# Altium schematic sheet 02_SERVO.SchDoc
size A4; SheetNumber: 2; SheetTotal: 2
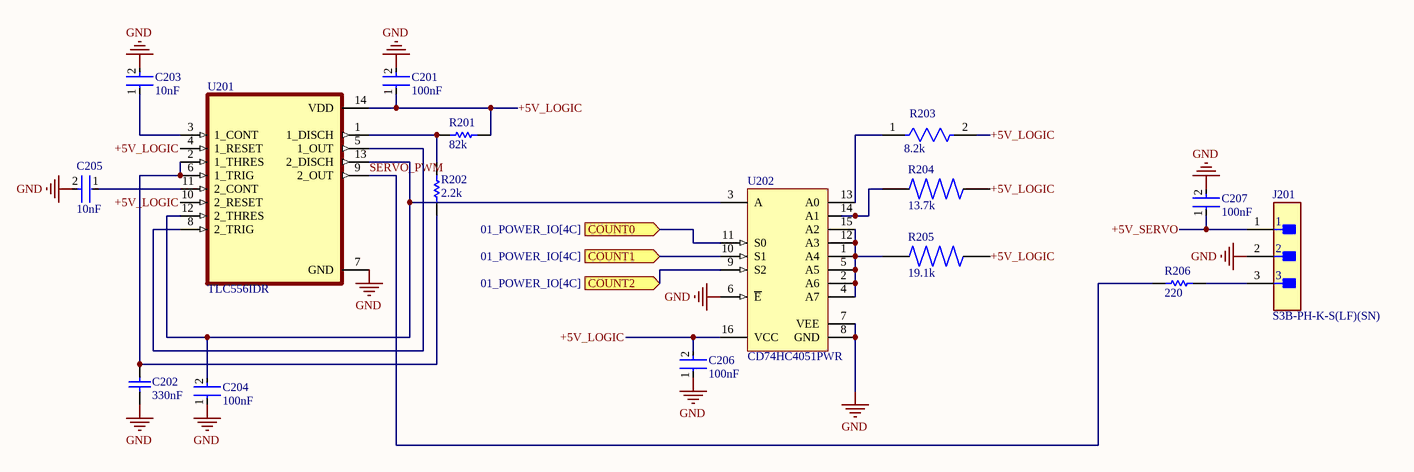
[diagram p0: 02_SERVO.SchDoc]

## Parts
C201  100nF  [FP-C1608-080-0_1-IPC_B]
C202  330nF  [CAPC1608X90X35NL10T15]
C203  10nF  [FP-C1608-080-0_1-MFG]
C204  100nF  [FP-C1608-080-0_1-IPC_B]
C205  10nF  [FP-C1608-080-0_1-MFG]
C206  100nF  [FP-C1608-080-0_1-IPC_B]
C207  100nF  [FP-C1608-080-0_1-IPC_B]
J201  S3B-PH-K-S(LF)(SN)  [FP-S3B-PH-K-S_LF_SN-MFG]
R201  82k  [RESC1608X55X25LL10T15]
R202  2.2k  [RESC1608X55X25LL10T15]
R203  8.2k  [FP-RC0603-0_55-MFG]
R204  13.7k  [RESC1608X55N]
R205  19.1k  [RESC1608X55N]
R206  220  [RESC1608X55X25ML10T15]
U201  TLC556IDR  [SOIC127P600X175-14N]
U202  CD74HC4051PWR  [PW0016A_M]

## Ports
COUNT0 (in, see 01_POWER_IO[4C]), COUNT1 (in, see 01_POWER_IO[4C]), COUNT2 (in, see 01_POWER_IO[4C])

## Nets
GND: C201.2 C202.1 C203.2 C204.1 C205.2 C206.1 C207.2 J201.2 U201.7(GND) U202.6(~{E}) U202.7(VEE) U202.8(GND)
+5V_LOGIC: C201.1 C206.2 R201.2 R203.2 R204.2 R205.2 U201.4(1_RESET) U201.10(2_RESET) U201.14(VDD) U202.16(VCC)
+5V_SERVO: C207.1 J201.1
COUNT0: U202.11(S0) ; port COUNT0
COUNT1: U202.10(S1) ; port COUNT1
COUNT2: U202.9(S2) ; port COUNT2
SERVO_PWM: R206.1 U201.9(2_OUT)
NetC202_2: C202.2 R202.1 U201.2(1_THRES) U201.6(1_TRIG)
NetC203_1: C203.1 U201.3(1_CONT)
NetC204_2: C204.2 U201.12(2_THRES) U201.13(2_DISCH) U202.3(A)
NetC205_1: C205.1 U201.11(2_CONT)
NetJ201_3: J201.3 R206.2
NetR201_1: R201.1 R202.2 U201.1(1_DISCH)
NetR203_1: R203.1 U202.13(A0)
NetR204_1: R204.1 U202.14(A1)
NetR205_1: R205.1 U202.1(A4) U202.2(A6) U202.4(A7) U202.5(A5) U202.12(A3) U202.15(A2)
NetU201_5: U201.5(1_OUT) U201.8(2_TRIG)

## Library data of the parts
C201 C204 C206 C207 = CMP-2000-04982-2: Multilayer Ceramic Capacitors 100nF ±10% 50V X7R SMD 0603; REACH SVHC: No SVHC; Voltage: 50V; Min Operating Temperature: -55°C; Package Quantity: 1; Case Code (Metric): 1608; Series: C; Termination: SMD/SMT; Length: 1.6mm; Voltage Rating: 50V; Case Code (Imperial): 0603; Number of Pins: 2; RoHS Compliant: Yes; Thickness: 0.037inch; Resistor Type: Ceramic; Radiation Hardening: No; Weight: 7.1E-05oz; Mount: Surface Mount; Capacitance: 100nF; Voltage Rating (DC): 50V; Construction: Flat; Tolerance: 10%; Lead Free: Lead Free; Case/Package: 0603; Max Operating Temperature: 125°C; Height: 0.8mm; Depth: 0.8mm; Packaging: Tape and Reel; Width: 0.031inch; Dielectric Material: Ceramic; Dielectric: X7R
C202 = CMP-2006-02854-1: Manufacturer: Murata; Part Number: GRM188R71C334KA01D
C203 C205 = CMP-2000-06026-2: Multilayer Ceramic Capacitors 10nF ±10% 50V X7R SMD 0603; Voltage: 50V; Depth: 0.8mm; REACH SVHC: No SVHC; Packaging: Tape and Reel; Dielectric Material: Ceramic; Dielectric: X7R; Min Operating Temperature: -55°C; Package Quantity: 1; Width: 0.031inch; Case Code (Imperial): 0603; Radiation Hardening: No; Length: 1.6mm; RoHS Compliant: Yes; Tolerance: 10%; Termination: SMD/SMT; Mount: Surface Mount; Construction: Flat; Resistor Type: Ceramic; Max Operating Temperature: 125°C; Series: C; Lead Free: Lead Free; Capacitance: 10nF; Voltage Rating (DC): 50V; Thickness: 0.037inch; Voltage Rating: 50V; Height: 0.8mm; Weight: 7.1E-05oz; Case/Package: 0603; Case Code (Metric): 1608
J201 = CMP-17439-000039-1: CONN HEADER R/A 3POS 2MM; Height: 0.31inch; Weight: 0.0625lb; Length: 0.31inch; Width: 0.31inch
R201 = CMP-2000-06947-1: Chip Resistor, 82 KOhm, +/- 1%, 0.1 W, -55 to 155 degC, 0603 (1608 Metric), RoHS, Tape and Reel; Manufacturer: Yageo; Temperature Coefficient: 100PPM/C; Unit Weight: 0.000071oz; Voltage Rating: 75V; Resistance: 82kOhms; Power Rating: 100mW; Packaging: Reel; Package Description: 2-Pin Surface Mount Device, Body 1.6 x 0.8 mm; Package / Case: 0603(1608metric); Series: RC; Operating Temperature Range: -55Cto+155C; Brand: Yageo; Case Code - in: 0603; Width: 0.8mm; Height: 0.45mm; Product Category: ThickFilmResistors; Length: 1.6mm; Product: ThickFilmResistorsGeneralPurpose; Manufacturer URL: http://www.yageo.com/; Datasheet URL: http://www.yageo.com/documents/recent/PYu-RC_Group_51_RoHS_L_7.pdf; RoHS: True; Datasheet Version: Rev. 7, 05/2017; Tolerance: 1%; Case Code - mm: 1608; Package Reference: 0603; Mounting Technology: SurfaceMount; Type: GeneralPurposeChipResistorSurfaceMount; Termination Style: SMD/SMT
R202 = CMP-2000-06934-1: Thick Film Resistor, 2.2 KOhm, 100 mW, 50 V, +/- 1%, -55 to 155 degC, 2-Pin SMD (0603), RoHS, Tape and Reel; Manufacturer: Yageo; Resistance: 2.2kOhms; Temperature Coefficient: 100PPM/C; Voltage Rating: 50V; Power Rating: 100mW; Tolerance: 1%; Datasheet Version: Rev. 7, 05/2017; Case Code - mm: 1608; Series: RC; Mounting Technology: SurfaceMount; Package Description: 2-Pin Surface Mount Device, Body 1.6 x 0.8 mm; Case Code - in: 0603; Package Reference: 0603; Product: ThickFilmResistorsGeneralPurpose; Manufacturer URL: http://www.yageo.com/; Termination Style: SMD/SMT; Operating Temperature Range: -55Cto+155C; Datasheet URL: http://www.yageo.com/documents/recent/PYu-RC_Group_51_RoHS_L_7.pdf; Packaging: Reel
R203 = CMP-1659-00040-2: NexarPartId: 40301092; Voltage Rating (AC): 50V; Resistance: 8.2kΩ; Power Rating: 100mW; Temperature Coefficient: 100ppm/°C; Tolerance: 1%; Number of Terminations: 2; Length: 1.6mm; Height: 450µm; Composition: Thick Film; Case Code (Imperial): 0603; Features: Moisture Resistant; Width: 800µm; Max Operating Temperature: 155°C; Lead Pitch: 300µm; Voltage Rating: 50V; Termination: SMD/SMT; Case Code (Metric): 1608; Max Power Dissipation: 100mW; REACH SVHC: No SVHC; Number of Pins: 2; Min Operating Temperature: -55°C; Case/Package: 0603; Packaging: Tape & Reel; Voltage Rating (DC): 50V; Schedule B: 8533210045, 8533210045; Lead Free: Lead Free; RoHS: Compliant; Military Standard: Not; Depth: 800µm
R204 = RC0603FR-0713K7L: 13.7 kOhms Â±1% 0.1W, 1/10W Chip Resistor 0603 (1608 Metric) Moisture Resistant Thick Film; MF: Yageo; SnapEDA_Link: https://www.snapeda.com/parts/RC0603FR-0713K7L/Yageo/view-part/?ref=snap; Package: 1608 Yageo; Value: *; MP: RC0603FR-0713K7L; Check_prices: https://www.snapeda.com/parts/RC0603FR-0713K7L/Yageo/view-part/?ref=eda
R205 = RC0603FR-0719K1L: 19.1 kOhms Â±1% 0.1W, 1/10W Chip Resistor 0603 (1608 Metric) Moisture Resistant Thick Film; MF: Yageo; SnapEDA_Link: https://www.snapeda.com/parts/RC0603FR-0719K1L/Yageo/view-part/?ref=snap; Package: 1608 Yageo; Value: *; MP: RC0603FR-0719K1L; Check_prices: https://www.snapeda.com/parts/RC0603FR-0719K1L/Yageo/view-part/?ref=eda
R206 = CMP-1659-00018-2: General Purpose Chip Resistors, 220 Ohm, +/- 1%, -55 to 155 degC, 0603 (1608 Metric), RoHS, Tape and Reel; RoHSCompliant: false; DatasheetVersion: Rev. 4, 04/2009; ComponentLink2Description: Datasheet; ComponentLink2URL: https://datasheet.ciiva.com/11808/0900766b80f96399-11808136.pdf; ComponentLink1URL: http://www.yageo.com/; ComponentLink1Description: Manufacturer URL; PackageReference: 0603; PackageDescription: 2-Pin Surface Mount Device, Body 1.6 x 0.8 mm
U201 = TLC556IDR: 15V Dual LinCMOS timer; MF: Texas Instruments; SnapEDA_Link: https://www.snapeda.com/parts/TLC556IDR/Texas+Instruments/view-part/?ref=snap; Package: SOIC-14 Texas Instruments; Value: *; MP: TLC556IDR; Check_prices: https://www.snapeda.com/parts/TLC556IDR/Texas+Instruments/view-part/?ref=eda
U202 = CMP-1575-00078-4: High Speed CMOS 8-Channel Analog Multiplexer/Demultiplexer, PW0016A, LARGE T&R; Manufacturer: Texas Instruments; Configuration: 1 X 1：8 MUX; Ron(Typ)(Ohms): 45; Crosstalk: Yes; Ron(Max)(Ohms): 130; VCC(Max)(V): 6; Rating: Catalog; VCC(Min)(V): 2; Bandwidth(Max)(MHz): 180; DatasheetVersion: SCHS122J; PackageReference: PW0016A; Output Type: CMOS; Operating Temperature Range(C): -55 to 125; PackageVersion: http://www.ti.com/lit/ml/mpds361/mpds361.pdf; Code_JEDEC: MO-153; Generic Part Number: CD74HC4051